# Altium project SSM_POWER.PrjPcb
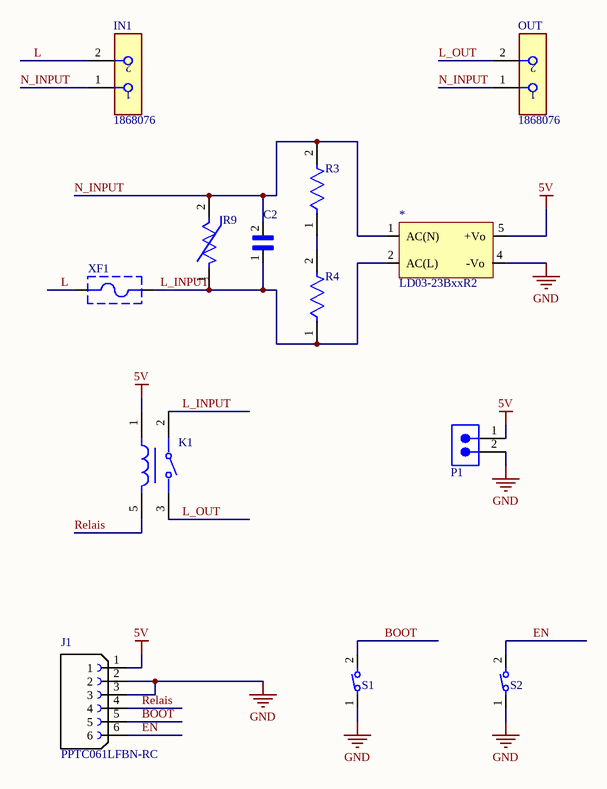
[diagram p0: POWER.SchDoc]
1 sheet, 13 parts. Net scope: global (net labels, ports and power ports of the same name join across sheets).
Board file: PCB_HV.PcbDoc

## Sheet POWER.SchDoc
size A4; SheetNumber: 1; SheetTotal: 1

### Parts
*  LD03-23BxxR2  [LD03-23BxxR2]
C2  B32921C3104M189  [*CAPRR1000W60L1300T600H1200]  (value not drawn)
IN1  1868076  [FP-1868076-MFG]
J1  PPTC061LFBN-RC  [*SULLINS_PPTC061LFBN-RC]
K1  G5Q-1A4-DC5  [FP-G5Q-1A4-DC5-MFG]  (value not drawn)
OUT  1868076  [FP-1868076-MFG]
P1  MTLW-102-05-G-S-172  [SMTC-MTLW-102-05-X-S-172]  (value not drawn)
R3  RES-THT_470k  [XTAL_ZTA-6.00MG]  (value not drawn)
R4  RES-THT_470k  [XTAL_ZTA-6.00MG]  (value not drawn)
R9  MOV-10D471K  [FP-MOV-10D471K-MFG]  (value not drawn)
S1  434123025816  [434123025816]  (value not drawn)
S2  434123025816  [434123025816]  (value not drawn)
XF1  696101000002  [696101000002]  (value not drawn)

### Nets
5V: *.5(+Vo) J1.1 K1.1 P1.1
GND: *.4(-Vo) J1.2 J1.3 P1.2 S1.1 S2.1
BOOT: J1.5 S1.2
EN: J1.6 S2.2
L: IN1.2 XF1.1
L_INPUT: *.2(AC(L)) C2.1 K1.2 R4.1 R9.1 XF1.2
L_OUT: K1.3 OUT.2
N_INPUT: *.1(AC(N)) C2.2 IN1.1 OUT.1 R3.2 R9.2
Relais: J1.4 K1.5
NetR3_1: R3.1 R4.2

### Library data of the parts
C2 = B32921C3104M189: Cap Film Suppression X2 0.1uF 305VAC PP 20% (13 X 6 X 12mm) Radial Plastic Rectangular Can 10mm 105C T/R; MF: EPCOS; Package: Package; Price: None; SnapEDA_Link: https://www.snapeda.com/parts/B32921C3104M189/EPCOS/view-part/?ref=snap; MP: B32921C3104M189; Availability: In Stock; Check_prices: https://www.snapeda.com/parts/B32921C3104M189/EPCOS/view-part/?ref=eda; Value: *
IN1 OUT = CMP-00298-00856132-1: 1868076 Conn Terminal Block 2 POS 7.62mm Solder ST Thru-Hole 32A Cardboard; NexarPartId: 856132; Wire Gauge (Min): 10AWG; Voltage: 300V; Number of Positions Per Level: 2; Number of Levels: 1; Current: 10A; Voltage Rating: 500V; Approvals: CSA, UL, cULus; Wire Gauge (Max): 30AWG; Stripping Length: 8mm; RoHS: Compliant; Number of Pins: 2; Housing Color: Green; Color: Green; Height: 19.05mm; Contact Material: Tin; Housing Material: Polyamide; Pitch: 7.62mm; Lead Free: Lead Free; Radiation Hardening: No; Mount: Through Hole; Number of Contacts: 2; Number of Circuits: 2; Number of Positions: 2; Orientation: Straight; Current Rating: 32A; Number of Rows: 1; Termination: Solder; Length: 22.86mm; Weight: 6.000006g; Number of Poles: 2; Width: 26.6mm; Flammability Rating: UL94 V-0; Depth: 12.5mm
J1 = PPTC061LFBN-RC: 6 Position Total Single Row 2.54 mm Pitch Straight Female Header; MF: Sullins Connector Solutions; MP: PPTC061LFBNRC; System: Connector; Package: None; Price: None; SnapEDA_Link: https://www.snapeda.com/parts/PPTC061LFBNRC/Sullins/view-part/?ref=snap; Availability: In Stock; Check_prices: https://www.snapeda.com/parts/PPTC061LFBNRC/Sullins/view-part/?ref=eda; Value: *
K1 = CMP-08822-000148-1: RELAY GEN PURPOSE SPST 10A 5V; Relay Type: General Purpose; Operate Time: 10ms; Approvals: UL; Voltage Rating (AC): 277V; Max Voltage Rating (DC): 30V; Power Consumption: 2mW; Coil Current: 40mA; Release Time: 5ms; Coil Type: Non-Latching; Coil Power: 200mW; Coil Resistance: 125R; Max Current Rating: 10A; Number of Pins: 4; Termination: PC Pin; Packaging: Bulk; Length: 20.3mm; Radiation Hardening: No; Throw Configuration: SPST; Mount: Through Hole; Max Voltage Rating (AC): 277V; Contact Material: Silver; Min Operating Temperature: -40°C; Current Rating: 10A; Max Operating Temperature: 105°C; Contact Current Rating: 10A; Package Quantity: 400; Series: G5Q; Coil Voltage (DC): 5V; Depth: 10.3mm; Weight: 6.5g
P1 = CMP-1024-00064-1: Low Profile .025" SQ Post Header, Through-hole, Vertical, -55 to 125 degC, 2.54 mm Pitch, 2-Pin, Male, RoHS; Manufacturer: Samtec; Pitch: 2.54 mm; ComponentLink2URL: http://www.samtec.com/documents/webfiles/pdf/MTLW_TH.PDF; PackageDescription: Low Profile Terminal Assembly; ComponentLink3URL: http://www.samtec.com/documents/webfiles/cpdf/MTLW-1XX-XX-XX-X-XXX-XX-XX-MKT1.pdf; PackageReference: MTLW-102-05-X-S-172; Mounting Technology: Through-hole; ComponentLink2Description: Datasheet; PackageVersion: T, 6/1991; Orientation: Vertical; DatasheetVersion: F-214; RoHS: True; ComponentLink3Description: Package Specification; ComponentLink1URL: http://www.samtec.com; Temperature Range: -55 to 125 degC; PartNumber: MTLW-102-05-G-S-172; ComponentLink1Description: Manufacturer URL
R3 R4 = RES-THT_470k: Through Hole Resistor; NexarPartId: 43762971; Temperature Coefficient: 50ppm/°C; Tolerance: 1%; Voltage Rating: 200V; Power Rating: 50mW; Lead Diameter: 410µm; Termination: Axial; Number of Terminations: 2; Max Operating Temperature: 175°C; Case/Package: Axial; Height: 2.03mm; Radiation Hardening: No; Mount: Through Hole; Diameter: 1.65mm; Length: 3.81mm; Width: 1.651mm; RoHS: Non-Compliant; Max Power Dissipation: 50mW; Features: Flame Retardant Coating, Military; Composition: Metal Film; Contact Plating: Lead, Tin; Packaging: Bulk; Military Standard: MIL-R-10509; Lead Free: Contains Lead; Min Operating Temperature: -65°C
R9 = CMP-07402-000002-1: VARISTOR 470V 2.5KA DISC 10MM; Manufacturer: Bourns Inc.; Voltage Tolerance: 10%; Clamping Voltage: 775V; Voltage Rating Dc: 385V; Capacitance: 252pF; Voltage Rating Ac: 300V; Value: 252pF; Clamping Current: 25A; Manufacturer Part Number: MOV-10D471K; Temperature: -40°C to +105°C; Lead Free: Yes; Automotive: No; Device Class L2: Varistors; Digikey Description: VARISTOR 470V 2.5KA DISC 10MM; Temperature Range Low: -40°C; Package: RADIAL; Varistor Voltage: 470V; Category: Res; RoHS: TRUE; Device Class L3: unset; Height: 15.5mm; Device Class L1: Circuit Protection; ComponentLink2Description: Datasheet; ComponentLink2URL: https://www.bourns.com/docs/product-datasheets/mov10d.pdf?sfvrsn=b57e8a7f_26; Temperature Range High: +105°C; Mouser Description: Var MOV 300VAC/385VDC 2500A 470V Thru-Hole Radial Bulk; Octopart: https://octopart.com/mov-10d471k-bourns-19184782
S1 S2 = 434123025816: Tactile Switch SPST-NO Top Actuated Surface Mount; MF: WÃ¼rth Elektronik; SnapEDA_Link: https://www.snapeda.com/parts/434123025816/W%25C3%25BCrth+Elektronik+Midcom/view-part/?ref=snap; Package: None; Value: *; MP: 434123025816; Check_prices: https://www.snapeda.com/parts/434123025816/W%25C3%25BCrth+Elektronik+Midcom/view-part/?ref=eda
XF1 = CMP-1502-00233-4: WR-FSH Fuse Holder Blocks Fuse Holder Blocks Clip Cover for PCB; Fuse Current: 10A; Voltage Rating (AC): 250V; Mount: Through Hole; REACH SVHC: Unknown; RoHS: Compliant; Height: 13.6mm; Packaging: Box; Min Operating Temperature: -30°C; Max Operating Temperature: 120°C